# Altium schematic sheet Sys_Power.SchDoc
size A4; SheetNumber: 9; SheetTotal: 11
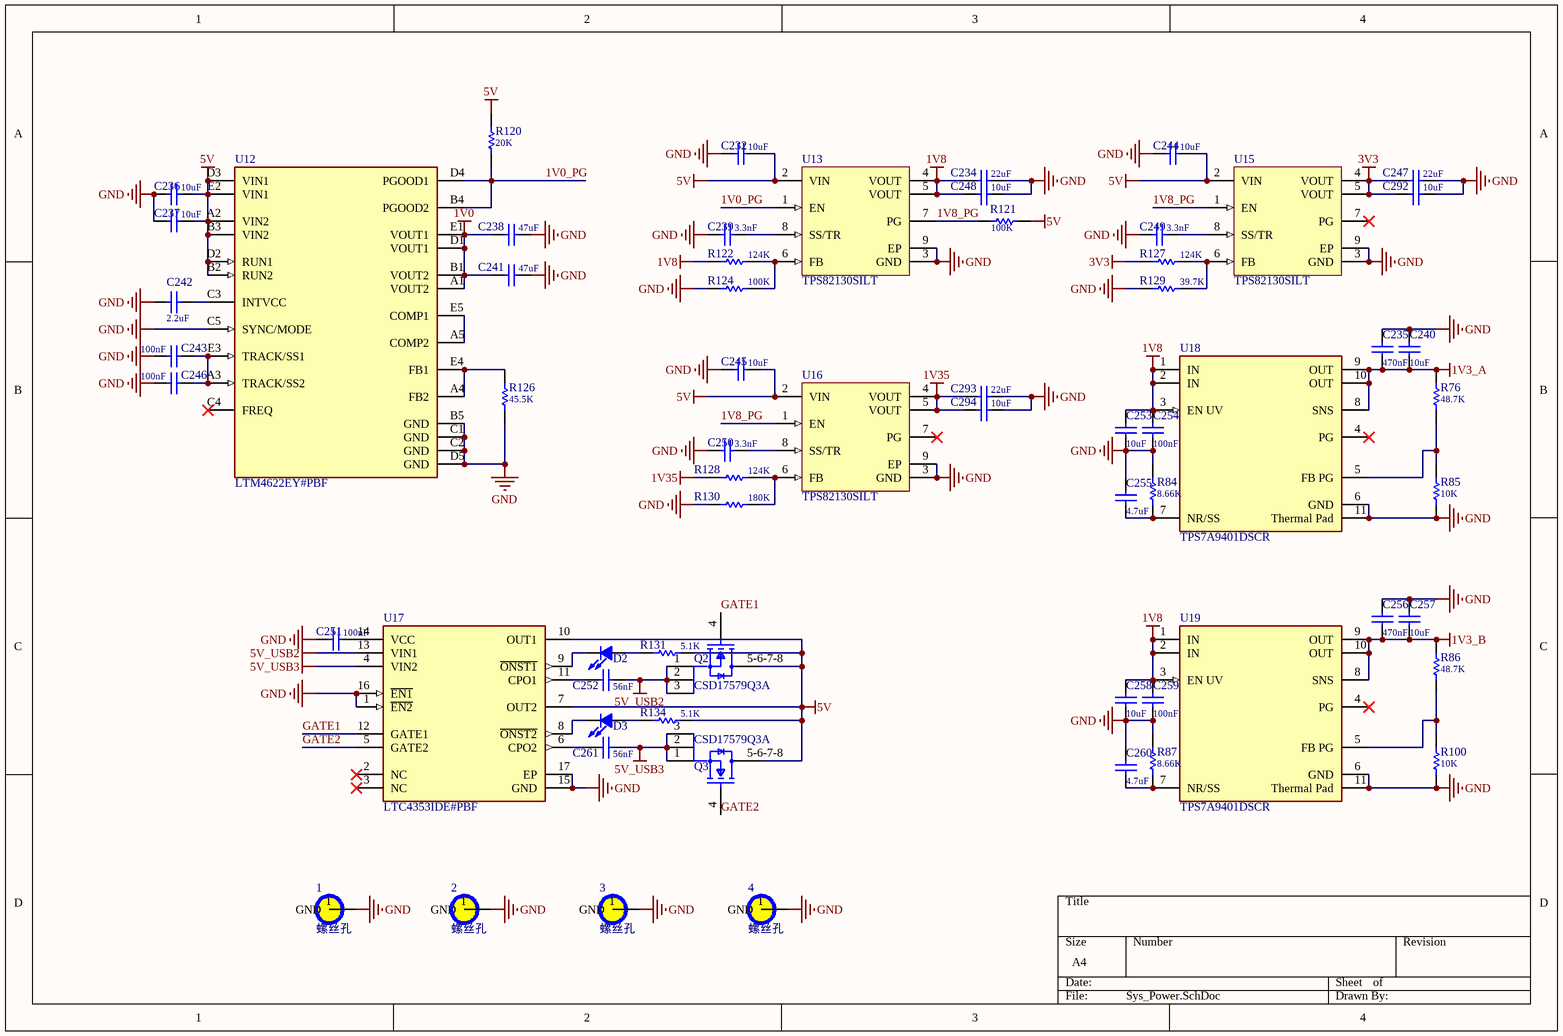
[diagram p0: Sys_Power.SchDoc]

## Parts
1  螺丝孔  [螺丝孔]
2  螺丝孔  [螺丝孔]
3  螺丝孔  [螺丝孔]
4  螺丝孔  [螺丝孔]
C232  value 10uF  [C0805-L]  (hidden comment: Cap-S)
C234  value 22uF  [C0805-L]  (hidden comment: Cap-S)
C235  value 470nF  [C0402-L]  (hidden comment: Cap-S)
C236  value 10uF  [C0805-L]  (hidden comment: Cap-S)
C237  value 10uF  [C0805-L]  (hidden comment: Cap-S)
C238  value 47uF  [C0805-L]  (hidden comment: Cap-S)
C239  value 3.3nF  [C0402-L]  (hidden comment: Cap-S)
C240  value 10uF  [C0603-L]  (hidden comment: Cap-S)
C241  value 47uF  [C0805-L]  (hidden comment: Cap-S)
C242  value 2.2uF  [C0603-L]  (hidden comment: Cap-S)
C243  value 100nF  [C0402-L]  (hidden comment: Cap-S)
C244  value 10uF  [C0805-L]  (hidden comment: Cap-S)
C245  value 10uF  [C0805-L]  (hidden comment: Cap-S)
C246  value 100nF  [C0402-L]  (hidden comment: Cap-S)
C247  value 22uF  [C0805-L]  (hidden comment: Cap-S)
C248  value 10uF  [C0603-L]  (hidden comment: Cap-S)
C249  value 3.3nF  [C0402-L]  (hidden comment: Cap-S)
C250  value 3.3nF  [C0402-L]  (hidden comment: Cap-S)
C251  value 100nF  [C0402-L]  (hidden comment: Cap-S)
C252  value 56nF  [C0402-L]  (hidden comment: Cap-S)
C253  value 10uF  [C0603-L]  (hidden comment: Cap-S)
C254  value 100nF  [C0402-L]  (hidden comment: Cap-S)
C255  value 4.7uF  [C0603-L]  (hidden comment: Cap-S)
C256  value 470nF  [C0402-L]  (hidden comment: Cap-S)
C257  value 10uF  [C0603-L]  (hidden comment: Cap-S)
C258  value 10uF  [C0603-L]  (hidden comment: Cap-S)
C259  value 100nF  [C0402-L]  (hidden comment: Cap-S)
C260  value 4.7uF  [C0603-L]  (hidden comment: Cap-S)
C261  value 56nF  [C0402-L]  (hidden comment: Cap-S)
C292  value 10uF  [C0603-L]  (hidden comment: Cap-S)
C293  value 22uF  [C0805-L]  (hidden comment: Cap-S)
C294  value 10uF  [C0603-L]  (hidden comment: Cap-S)
D2  LED  [LED_0603_L]  (value not drawn)
D3  LED  [LED_0603_L]  (value not drawn)
Q2  CSD17579Q3A  [FP-DNH0008A-MFG]
Q3  CSD17579Q3A  [FP-DNH0008A-MFG]
R76  value 48.7K  [R0402-L]  (hidden comment: R)
R84  value 8.66K  [R0402-L]  (hidden comment: R)
R85  value 10K  [R0402-L]  (hidden comment: R)
R86  value 48.7K  [R0402-L]  (hidden comment: R)
R87  value 8.66K  [R0402-L]  (hidden comment: R)
R100  value 10K  [R0402-L]  (hidden comment: R)
R120  value 20K  [R0402-L]  (hidden comment: R)
R121  value 100K  [R0402-L]  (hidden comment: R)
R122  value 124K  [R0402-L]  (hidden comment: R)
R124  value 100K  [R0402-L]  (hidden comment: R)
R126  value 45.5K  [R0402-L]  (hidden comment: R)
R127  value 124K  [R0402-L]  (hidden comment: R)
R128  value 124K  [R0402-L]  (hidden comment: R)
R129  value 39.7K  [R0402-L]  (hidden comment: R)
R130  value 180K  [R0402-L]  (hidden comment: R)
R131  value 5.1K  [R0402-L]  (hidden comment: R)
R134  value 5.1K  [R0402-L]  (hidden comment: R)
U12  LTM4622EY#PBF  [FP-BGA-25-05-08-1502-IPC_C]
U13  TPS82130SILT  [SIL0008D_V]
U15  TPS82130SILT  [SIL0008D_V]
U16  TPS82130SILT  [SIL0008D_V]
U17  LTC4353IDE#PBF  [FP-DE-16-05-08-1732-IPC_C]
U18  TPS7A9401DSCR  [FP-DSC0010J-MFG]
U19  TPS7A9401DSCR  [FP-DSC0010J-MFG]

## Nets
1V0: C238.2 C241.1 U12.A1(VOUT2) U12.B1(VOUT2) U12.D1(VOUT1) U12.E1(VOUT1)
1V3_A: C235.1 C240.1 R76.1 U18.8(SNS) U18.9(OUT) U18.10(OUT)
1V3_B: C256.1 C257.1 R86.1 U19.8(SNS) U19.9(OUT) U19.10(OUT)
1V8: C234.2 C248.2 C253.2 C254.2 C258.2 C259.2 R122.2 U13.4(VOUT) U13.5(VOUT) U18.1(IN) U18.2(IN) U18.3(EN_UV) U19.1(IN) U19.2(IN) U19.3(EN_UV)
1V35: C293.2 C294.2 R128.2 U16.4(VOUT) U16.5(VOUT)
3V3: C247.2 C292.2 R127.2 U15.4(VOUT) U15.5(VOUT)
5V: C232.2 C236.2 C237.2 C244.2 C245.2 Q2.5-6-7-8(D) Q3.5-6-7-8(D) R120.2 R121.2 R131.1 R134.1 U12.A2(VIN2) U12.B2(RUN2) U12.B3(VIN2) U12.D2(RUN1) U12.D3(VIN1) U12.E2(VIN1) U13.2(VIN) U15.2(VIN) U16.2(VIN) U17.7(OUT2) U17.10(OUT1)
5V_USB2: C252.2 Q2.1(S) Q2.2(S) Q2.3(S) U17.13(VIN1)
5V_USB3: C261.2 Q3.1(S) Q3.2(S) Q3.3(S) U17.4(VIN2)
GND: 1.1(GND) 2.1(GND) 3.1(GND) 4.1(GND) C232.1 C234.1 C235.2 C236.1 C237.1 C238.1 C239.1 C240.2 C241.2 C242.2 C243.1 C244.1 C245.1 C246.1 C247.1 C248.1 C249.1 C250.1 C251.2 C253.1 C254.1 C255.1 C256.2 C257.2 C258.1 C259.1 C260.1 C292.1 C293.1 C294.1 R84.2 R85.2 R87.2 R100.2 R124.1 R126.1 R129.1 R130.1 U12.B5(GND) U12.C1(GND) U12.C2(GND) U12.C5(SYNC/MODE) U12.D5(GND) U13.3(GND) U13.9(EP) U15.3(GND) U15.9(EP) U16.3(GND) U16.9(EP) U17.1(~{EN2}) U17.15(GND) U17.16(~{EN1}) U17.17(EP) U18.6(GND) U18.11(Thermal_Pad) U19.6(GND) U19.11(Thermal_Pad)
1V0_PG: R120.1 U12.B4(PGOOD2) U12.D4(PGOOD1) U13.1(EN)
1V8_PG: R121.1 U13.7(PG) U15.1(EN) U16.1(EN)
GATE1: Q2.4(G) U17.12(GATE1)
GATE2: Q3.4(G) U17.5(GATE2)
NetC239_2: C239.2 U13.8(SS/TR)
NetC242_1: C242.1 U12.C3(INTVCC)
NetC243_2: C243.2 C246.2 U12.A3(TRACK/SS2) U12.E3(TRACK/SS1)
NetC249_2: C249.2 U15.8(SS/TR)
NetC250_2: C250.2 U16.8(SS/TR)
NetC251_1: C251.1 U17.14(VCC)
NetC252_1: C252.1 U17.11(CPO1)
NetC255_2: C255.2 R84.1 U18.7(NR/SS)
NetC260_2: C260.2 R87.1 U19.7(NR/SS)
NetC261_1: C261.1 U17.6(CPO2)
NetD2_1: D2.1 R131.2
NetD2_2: D2.2 U17.9(~{ONST1})
NetD3_1: D3.1 R134.2
NetD3_2: D3.2 U17.8(~{ONST2})
NetR76_2: R76.2 R85.1 U18.5(FB_PG)
NetR86_2: R86.2 R100.1 U19.5(FB_PG)
NetR122_1: R122.1 R124.2 U13.6(FB)
NetR126_2: R126.2 U12.A4(FB2) U12.E4(FB1)
NetR127_1: R127.1 R129.2 U15.6(FB)
NetR128_1: R128.1 R130.2 U16.6(FB)
NetU12_A5: U12.A5(COMP2) U12.E5(COMP1)

Not connected (* = marked no-connect by the designer): U12 C4(FREQ)*; U15 7(PG)*; U16 7(PG)*; U17 2(NC)* 3(NC)*; U18 4(PG)*; U19 4(PG)*

## Library data of the parts
C232 C234-C261 C292-C294 = Cap-S: 贴片瓷片电容
D2 D3 = LED: 发光二极管
Q2 Q3 = CMP-04962-000055-1: MOSFET N-CH 30V 35A 8VSON; Rise Time: 5ns; Fall Time: 1ns; Max Power Dissipation: 3.2W; Turn-On Delay Time: 2ns; Rds On Max: 10.2mR; Turn-Off Delay Time: 11ns; Gate to Source Voltage (Vgs): 20V; Continuous Drain Current (ID): 20A; Element Configuration: Single; Input Capacitance: 998pF; Packaging: Tape and Reel; Lead Free: Lead Free; Min Operating Temperature: -55°C; Number of Pins: 8; Contact Plating: Copper; Mount: Surface Mount; RoHS Compliant: Yes; Drain to Source Voltage (Vdss): 30V; Max Operating Temperature: 150°C
R76 R84-R87 R100 R120-R122 R124 R126-R131 R134 = Res: 贴片电阻
U12 = CMP-09139-000313-1: DC DC CNVRTR 0.6-5.5V 0.6-5.5V; Max Output Current: 2.5A; Output Current: 5A; Min Output Voltage: 600mV; Max Input Voltage: 20V; Min Input Voltage: 3.6V; Switching Frequency: 1MHz; Number of Outputs: 2; Max Output Voltage: 5.5V; REACH SVHC: No SVHC; Mount: Surface Mount; Number of Pins: 25; Case/Package: BGA; Packaging: Tray; RoHS Compliant: Yes; Min Operating Temperature: -40°C; Height: 0.07inch; Features: OVP; Length: 0.25inch; Max Operating Temperature: 125°C; Voltage - Output 1: 5.5V; Width: 0.25inch
U13 U15 U16 = CMP-2000-07569-1: Step-Down Converter MicroSiP(TM) Module with Integrated Inductor, 3 A, 3 to 17 V, -40 to 125 degC, 8-Pin uSiP (SIL), Tape and Reel; Manufacturer: Texas Instruments; Quiescent Current: 20uA; Output Voltage: 5V; Output Current: 3A; Max Input Voltage: 17V; Switching Frequency: 2MHz; Min Output Voltage: 900mV; Number of Outputs: 1; Min Input Voltage: 3V; Datasheet URL: http://www.ti.com/lit/ds/symlink/tps82130.pdf; Packaging: CutTape; Datasheet Version: Rev. C, 01/2017; Package Reference: SIL0008D; Case/Package: SMD/SMT; Manufacturer URL: http://www.ti.com/; Length: 0.12inch; Lead Free: LeadFree; Mount: SurfaceMount; Number of Pins: 8; Package Description: 8-Pin Single In-line Package, Body 3 x 2.8 mm, Pitch 0.65 mm; Max Output Voltage: 5V; Mounting Technology: SurfaceMount; Height: 0.06inch; Max Operating Temperature: 125degC; Width: 0.11inch; Min Operating Temperature: -40degC; Voltage - Output 1: 5V; RoHSCompliant: True; REACH SVHC: NoSVHC; Max Output Current: 3A
U17 = CMP-0479-00067-2: IC OR CTRLR LOAD SHARE 16DFN; Turn-On Delay Time: 400ns; Turn-Off Delay Time: 1us; Number of Drivers: 2; Propagation Delay: 1000ns; Max Supply Voltage: 18V; Min Supply Voltage: 3V; Number of Pins: 16; Case/Package: DFN EP; Package Quantity: 91; REACH SVHC: No SVHC; RoHS Compliant: Yes; Lead Free: Lead Free; Max Operating Temperature: 85°C; Min Operating Temperature: -40°C; Series: -; Number of Outputs: 2
U18 U19 = CMP-04917-000380-1: 1-A, ULTRA-LOW NOISE, ULTRA-HIGH